# Altium project Interface-Board.PrjPcb
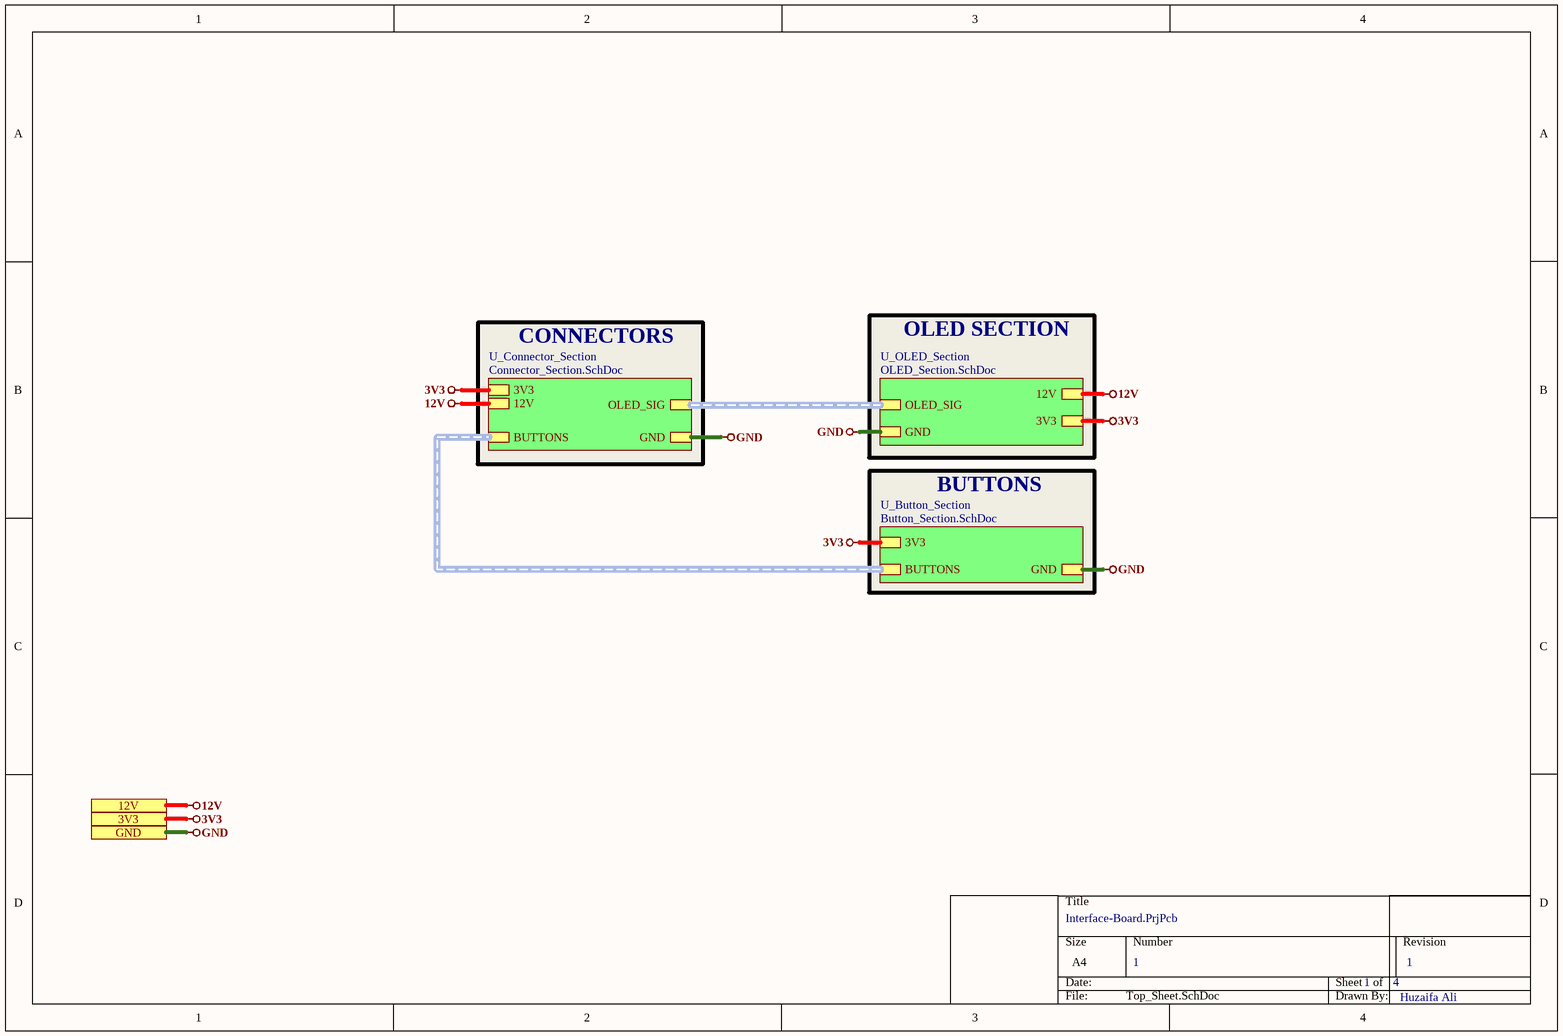
[diagram p0: Top_Sheet.SchDoc]
4 sheets, 19 parts. Net scope: hierarchical (ports join the sheet entries above them; power ports are global).
Board file: Interface_PCB.PcbDoc
Sheets:
  Top_Sheet.SchDoc
    U_Connector_Section = Connector_Section.SchDoc
    U_OLED_Section = OLED_Section.SchDoc
    U_Button_Section = Button_Section.SchDoc

## Sheet Top_Sheet.SchDoc: =Projectname
size A4; SheetNumber: 1; SheetTotal: 4

### Sub-sheets
U_Button_Section = Button_Section.SchDoc: BUTTONS (harness BUTTONS), 3V3, GND
U_Connector_Section = Connector_Section.SchDoc: OLED_SIG (harness OLED_SIG), BUTTONS (harness BUTTONS), 3V3, 12V, GND
U_OLED_Section = OLED_Section.SchDoc: 12V, 3V3, GND, OLED_SIG (harness OLED_SIG)

### Ports
3V3, 12V, GND

### Nets
3V3: port 3V3, sheet U_Connector_Section/3V3, sheet U_OLED_Section/3V3, sheet U_Button_Section/3V3
12V: port 12V, sheet U_Connector_Section/12V, sheet U_OLED_Section/12V
GND: port GND, sheet U_Connector_Section/GND, sheet U_OLED_Section/GND, sheet U_Button_Section/GND

### Buses and harness runs
harness sheet U_Button_Section/BUTTONS = sheet U_Connector_Section/BUTTONS
harness sheet U_Connector_Section/OLED_SIG = sheet U_OLED_Section/OLED_SIG

### Notes on the sheet
- CONNECTORS
- OLED SECTION
- BUTTONS
- 1
- Huzaifa Ali

## Sheet Connector_Section.SchDoc: =Projectname
size A4; SheetNumber: 3; SheetTotal: 4
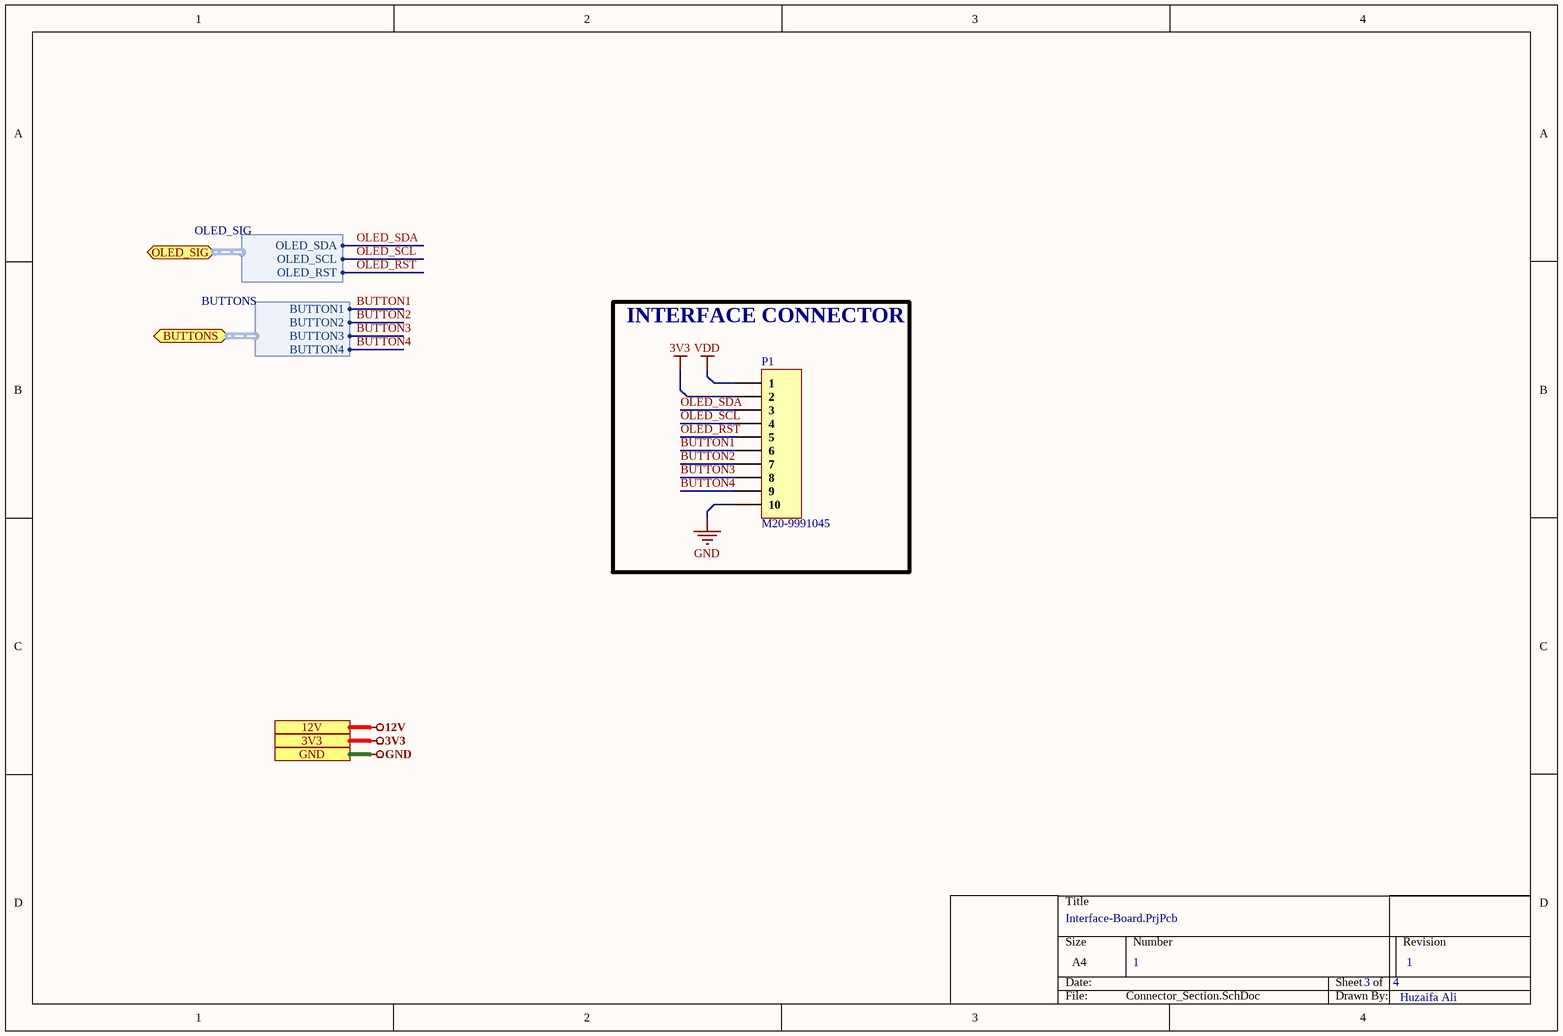
[diagram p1: Connector_Section.SchDoc]

### Parts
P1  M20-9991045  [HDR1X10]

### Blocks framed on the sheet
INTERFACE CONNECTOR: P1

### Ports
3V3, 12V, BUTTONS (bidir, harness BUTTONS), GND, OLED_SIG (bidir, harness OLED_SIG)

### Harnesses
OLED_SIG: OLED_SDA, OLED_SCL, OLED_RST
BUTTONS: BUTTON1, BUTTON2, BUTTON3, BUTTON4

### Nets
3V3: P1.2 ; port 3V3
GND: P1.10 ; port GND
VDD: P1.1
BUTTON1: P1.6 ; port BUTTONS.BUTTON1
BUTTON2: P1.7 ; port BUTTONS.BUTTON2
BUTTON3: P1.8 ; port BUTTONS.BUTTON3
BUTTON4: P1.9 ; port BUTTONS.BUTTON4
OLED_RST: P1.5 ; port OLED_SIG.OLED_RST
OLED_SCL: P1.4 ; port OLED_SIG.OLED_SCL
OLED_SDA: P1.3 ; port OLED_SIG.OLED_SDA

### Notes on the sheet
- 1
- Huzaifa Ali

### Library data of the parts
P1 = M20-9991045: CONN HEADER VERT 10POS 2.54MM; Manufacturer: Harwin; Number of Contacts: 10; Max Current Rating: 3A; Contact Resistance: 25mR; Gender: Male; Insulation Resistance: 10GR; Connector Type: Male Pin; Supplier 1: Digi-Key; Manufacturer Part Number: M20-9991045; Stock 1: 1623; Pricing 1: 1=0.44, 10=0.413, 100=0.2891, 500=0.2478, 1000=0.2065, 5000=0.177, 10000=0.1652 (USD); Mount: Through Hole; Case/Package: SIL; Weight: 0.020459oz; Color: Black; Contact Plating: Gold; Contact Material: Brass,Bronze; Housing Color: Black; Housing Material: Nylon; Min Operating Temperature: -40°C; Max Operating Temperature: 105°C; Number of Rows: 1; Termination: Solder; Packaging: Bulk; Current Rating: 3A; Package Quantity: 500; Number of Positions: 10; Orientation: Straight; Length: 25.4mm; Height: 0.125inch; Width: 0.5inch; Pitch: 2.54mm; Contact Mating Length: 0.24inch; Depth: 2.54mm; Radiation Hardening: No; REACH SVHC: No SVHC; ComponentLink1URL: http://www.mouser.com/ds/2/181/Harwin_Product_Catalog_page_206-1134556.pdf?src-supplier=Mouser; ComponentLink1Description: http://www.mouser.com/ds/2/181/Harwin_Product_Catalog_page_206-1134556.pdf?src-supplier=Mouser; ComponentLink2URL: http://www.farnell.com/cad/689114.pdf?src-supplier=Element14; ComponentLink2Description: http://www.farnell.com/cad/689114.pdf?src-supplier=Element14; Supplier Part Number 1: 952-1842-ND

## Sheet OLED_Section.SchDoc
size A4; SheetNumber: 2; SheetTotal: 4
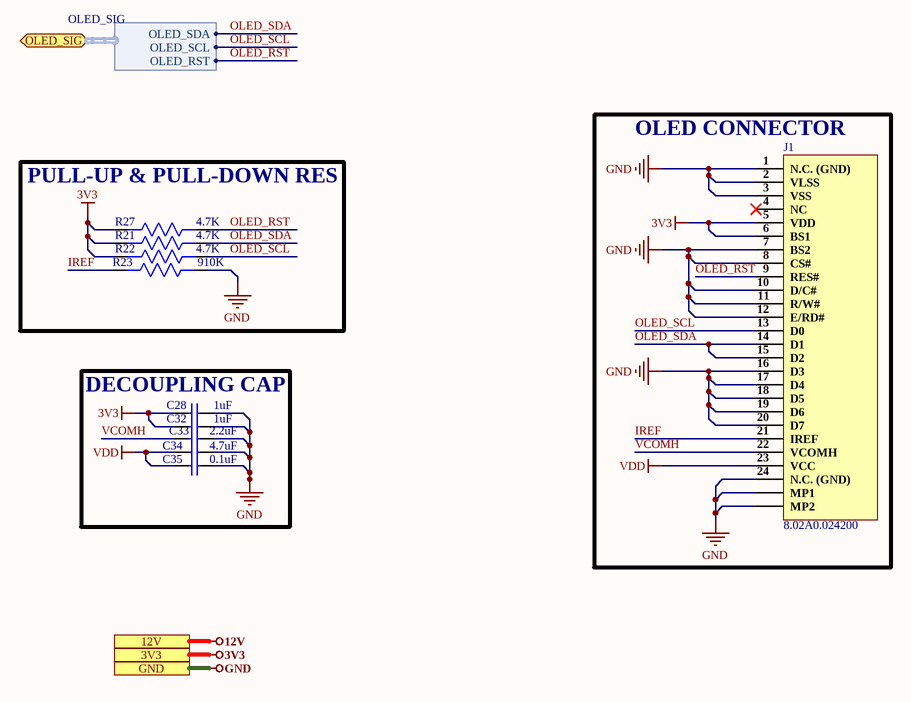
[diagram p2: OLED_Section.SchDoc]

### Parts
C28  1uF  [Cap 0402]
C32  1uF  [Cap 0402]
C33  2.2uF  [Cap 0402]
C34  4.7uF  [Cap 0603]
C35  0.1uF  [Cap 0402]
J1  8.02A0.024200  [8.02A0.024200]
R21  4.7K  [Res0402]
R22  4.7K  [Res0402]
R23  910K  [Res0603]
R27  4.7K  [Res0402]

### Blocks framed on the sheet
OLED CONNECTOR: J1
PULL-UP & PULL-DOWN RES: R21-R23 R27
DECOUPLING CAP: C28 C32-C35

### Ports
3V3, 12V, GND, OLED_SIG (bidir, harness OLED_SIG)

### Harnesses
OLED_SIG: OLED_SDA, OLED_SCL, OLED_RST

### Nets
3V3: C28.1 C32.1 J1.5(VDD) J1.6(BS1) R21.2 R22.2 R27.2 ; port 3V3
GND: C28.2 C32.2 C33.2 C34.2 C35.2 J1.1(N.C._(GND)) J1.2(VLSS) J1.3(VSS) J1.7(BS2) J1.8(CS#) J1.10(D/C#) J1.11(R/W#) J1.12(E/RD#) J1.16(D3) J1.17(D4) J1.18(D5) J1.19(D6) J1.20(D7) J1.24(N.C._(GND)) J1.MP1 J1.MP2 R23.1 ; port GND
VDD: C34.1 C35.1 J1.23(VCC)
IREF: J1.21(IREF) R23.2
OLED_RST: J1.9(RES#) R27.1 ; port OLED_SIG.OLED_RST
OLED_SCL: J1.13(D0) R22.1 ; port OLED_SIG.OLED_SCL
OLED_SDA: J1.14(D1) J1.15(D2) R21.1 ; port OLED_SIG.OLED_SDA
VCOMH: C33.1 J1.22(VCOMH)

Not connected (* = marked no-connect by the designer): J1 4(NC)*

### Notes on the sheet
- 1
- Huzaifa Ali

### Library data of the parts
C28 C32 = GRM155R61E105KA12D: CAP CER 1UF 25V X5R 0402; Manufacturer: Murata; Material: Ceramic; Tolerance: 10%; Supplier 1: Digi-Key; Manufacturer Part Number: GRM155R61E105KA12D; Stock 1: 1194305; Pricing 1: 1=0.11, 10=0.077, 100=0.0363, 500=0.02546, 1000=0.02108, 2500=0.01962, 5000=0.01795 (USD); Mount: Surface Mount; Case/Package: 0402; Weight: 0.000212oz; Case Code (Metric): 1005; Case Code (Imperial): 0402; Min Operating Temperature: -55°C; Max Operating Temperature: 85°C; Capacitance: 1uF; Voltage Rating: 25V; Packaging: Tape and Reel; Dielectric: X5R; Voltage: 25V; Termination: SMD/SMT; Voltage Rating (DC): 25V; Package Quantity: 10000; Length: 1mm; Height: 0.5mm; Width: 0.5mm; Thickness: 0.022inch; Depth: 0.5mm; REACH SVHC: No SVHC; Lead Free: Lead Free; ComponentLink1URL: http://www.farnell.com/datasheets/2048341.pdf?src-supplier=Element14; ComponentLink1Description: http://www.farnell.com/datasheets/2048341.pdf?src-supplier=Element14; Supplier Part Number 1: 490-10017-1-ND
C33 = EMK105ABJ225KV-F: CAP CER 2.2UF 16V X5R 0402; Manufacturer: Taiyo Yuden; Tolerance: 10%; Supplier 1: Digi-Key; Manufacturer Part Number: EMK105ABJ225KV-F; Stock 1: 755; Pricing 1: 1=0.2, 10=0.139, 100=0.0706, 500=0.04834, 1000=0.04276, 2500=0.0409, 5000=0.03718 (USD); Mount: Surface Mount; Case/Package: 0402; Case Code (Imperial): 0402; Case Code (Metric): 1005; Min Operating Temperature: -55°C; Max Operating Temperature: 85°C; Packaging: Tape and Reel; Capacitance: 2.2uF; Voltage Rating: 16V; Lead Free: Lead Free; ComponentLink1URL: http://ds.yuden.co.jp/TYCOMPAS/ut/detail.do?productNo=EMK105ABJ225KV-F&amp;fileName=EMK105ABJ225KV-F_SS&amp;mode=specSheetDownload&src-supplier=Digi-Key; ComponentLink1Description: http://ds.yuden.co.jp/TYCOMPAS/ut/detail.do?productNo=EMK105ABJ225KV-F&amp;fileName=EMK105ABJ225KV-F_SS&amp;mode=specSheetDownload&src-supplier=Digi-Key; ComponentLink2URL: https://ds.yuden.co.jp/TYCOMPAS/ut/detail?pn=EMK105ABJ225KV-F &amp;u=M&src-supplier=Digi-Key; ComponentLink2Description: https://ds.yuden.co.jp/TYCOMPAS/ut/detail?pn=EMK105ABJ225KV-F &amp;u=M&src-supplier=Digi-Key; Supplier Part Number 1: 587-6002-1-ND
C34 = CL10A475KA8NQNC: CAP CER 4.7UF 25V X5R 0603; Manufacturer: Samsung; Tolerance: 10%; Supplier 1: Digi-Key; Manufacturer Part Number: CL10A475KA8NQNC; Stock 1: 2252340; Pricing 1: 1=0.37, 10=0.255, 100=0.1528, 500=0.11456, 1000=0.09675 (USD); Mount: Surface Mount; Case/Package: 0603; Case Code (Metric): 1608; Case Code (Imperial): 0603; Contact Plating: Tin; Min Operating Temperature: -55°C; Max Operating Temperature: 85°C; Package Quantity: 1; Packaging: Tape and Reel; Capacitance: 4.7uF; Voltage Rating: 25V; Dielectric: X5R; Termination: Wraparound; Length: 1.6mm; Width: 0.031inch; Thickness: 0.035inch; Depth: 0.8mm; Lead Free: Lead Free; ComponentLink1URL: http://www.samsungsem.com/kr/support/product-search/mlcc/CL10A475KA8NQNC.jsp?src-supplier=Digi-Key; ComponentLink1Description: http://www.samsungsem.com/kr/support/product-search/mlcc/CL10A475KA8NQNC.jsp?src-supplier=Digi-Key; Supplier Part Number 1: 1276-1900-1-ND
C35 = CC0402KRX7R7BB104: CAP CER 0.1UF 16V X7R 0402; Manufacturer: Yageo; Tolerance: 10%; Capacitance: 100nF; Supplier 1: Digi-Key; Manufacturer Part Number: CC0402KRX7R7BB104; Stock 1: 16982736; Pricing 1: 1=0.1, 10=0.034, 100=0.015, 500=0.0107, 1000=0.00841, 2500=0.00764, 5000=0.00703 (USD); Mount: Surface Mount; Case/Package: 0402; Number of Pins: 2; Case Code (Metric): 1005; Case Code (Imperial): 0402; Min Operating Temperature: -55°C; Max Operating Temperature: 125°C; Dielectric: X7R; Voltage Rating: 16V; Voltage Rating (DC): 16V; Packaging: Tape and Reel; Package Quantity: 1; Termination: SMD/SMT; Composition: Ceramic; Voltage: 16V; Length: 1mm; Height: 0.5mm; Width: 0.02inch; Thickness: 0.022inch; Depth: 0.5mm; Radiation Hardening: No; REACH SVHC: No SVHC; Lead Free: Lead Free; Halogen Free: Halogen Free; ComponentLink1URL: http://www.yageo.com/documents/recent/UPY-GPHC_X7R_6.3V-to-50V_8.pdf?src-supplier=Avnet+Europe; ComponentLink1Description: http://www.yageo.com/documents/recent/UPY-GPHC_X7R_6.3V-to-50V_8.pdf?src-supplier=Avnet+Europe; ComponentLink2URL: http://www.yageo.com/documents/recent/UPY-GPHC_X7R_6.3V-to-50V_18.pdf?src-supplier=Digi-Key; ComponentLink2Description: http://www.yageo.com/documents/recent/UPY-GPHC_X7R_6.3V-to-50V_18.pdf?src-supplier=Digi-Key; ComponentLink3URL: http://www.yageo.com/documents/recent/UPY-GPHC_X7R_6.3V-to-50V_8.pdf?src-supplier=Avnet; ComponentLink3Description: http://www.yageo.com/documents/recent/UPY-GPHC_X7R_6.3V-to-50V_8.pdf?src-supplier=Avnet; ComponentLink4URL: http://www.yageo.com/documents/recent/UPY-GPHC_X7R_6.3V-to-50V_18.pdf?src-supplier=Mouser; ComponentLink4Description: http://www.yageo.com/documents/recent/UPY-GPHC_X7R_6.3V-to-50V_18.pdf?src-supplier=Mouser; ComponentLink5URL: http://www.farnell.com/datasheets/2167236.pdf?src-supplier=Element14; ComponentLink5Description: http://www.farnell.com/datasheets/2167236.pdf?src-supplier=Element14; ComponentLink6URL: http://www.farnell.com/datasheets/1489800.pdf?src-supplier=Element14; ComponentLink6Description: http://www.farnell.com/datasheets/1489800.pdf?src-supplier=Element14; Supplier Part Number 1: 311-1338-1-ND
J1 = 8.02A0.024200: FPC Connector 0.5mm pitch 24pin 30pin TOP&bottom conduction Zif Smt Lcd/epaper Fpc Ffc Connector; ComponentLink1Description: Alibaba; ComponentLink1URL: https://www.alibaba.com/product-detail/FPC-Connector-0-5mm-pitch-24pin_1600228276659.html; Manufacturer: *; Manufacturer Part No: 8.02A0.024200; Package: *
R21 R22 R27 = CR0402JF0472G: 4.7K ±5% 1/16W ±200ppm/°C 0402 Chip Resistor - Surface Mount RoHS; Manufacturer: LIZ Elec; Manufacturer Part No: CR0402JF0472G; Package: 0402; Value: 4.7K
R23 = 0603WAF9103T5E: ±1% 1/10W Thick Film Resistors 75V ±100ppm/℃ -55℃~+155℃ 910kΩ 0603 Chip Resistor - Surface Mount ROHS; Manufacturer: UNI-ROYAL; Manufacturer Part No: 0603WAF9103T5E; Package: 0603; Value: 910K; ComponentLink1Description: LCSC; ComponentLink1URL: https://lcsc.com/product-detail/Chip-Resistor-Surface-Mount_UNI-ROYAL-Uniroyal-Elec-0603WAF9103T5E_C23263.html

## Sheet Button_Section.SchDoc: =Projectname
size A4; SheetNumber: 4; SheetTotal: 4
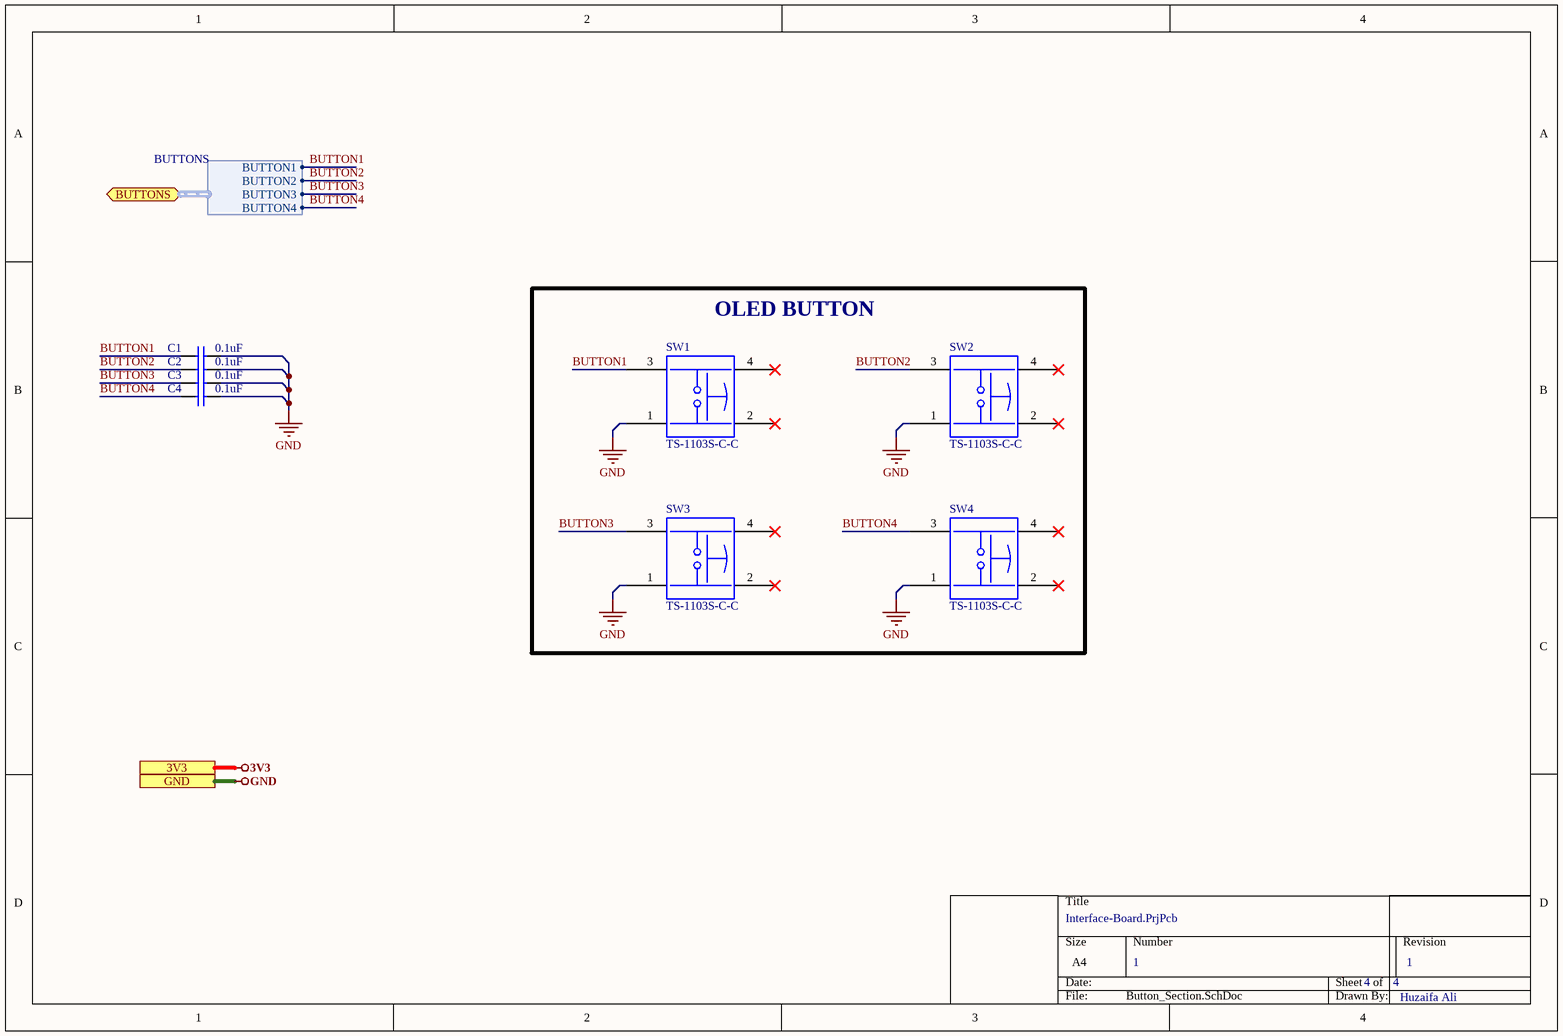
[diagram p3: Button_Section.SchDoc]

### Parts
C1  0.1uF  [Cap 0402]
C2  0.1uF  [Cap 0402]
C3  0.1uF  [Cap 0402]
C4  0.1uF  [Cap 0402]
SW1  TS-1103S-C-C  [TS-1103S-C-C]
SW2  TS-1103S-C-C  [TS-1103S-C-C]
SW3  TS-1103S-C-C  [TS-1103S-C-C]
SW4  TS-1103S-C-C  [TS-1103S-C-C]

### Blocks framed on the sheet
OLED BUTTON: SW1-SW4

### Ports
3V3, BUTTONS (bidir, harness BUTTONS), GND

### Harnesses
BUTTONS: BUTTON1, BUTTON2, BUTTON3, BUTTON4

### Nets
GND: C1.2 C2.2 C3.2 C4.2 SW1.1 SW2.1 SW3.1 SW4.1 ; port GND
BUTTON1: C1.1 SW1.3 ; port BUTTONS.BUTTON1
BUTTON2: C2.1 SW2.3 ; port BUTTONS.BUTTON2
BUTTON3: C3.1 SW3.3 ; port BUTTONS.BUTTON3
BUTTON4: C4.1 SW4.3 ; port BUTTONS.BUTTON4

Not connected (* = marked no-connect by the designer): SW1 2* 4*; SW2 2* 4*; SW3 2* 4*; SW4 2* 4*

### Notes on the sheet
- 1
- Huzaifa Ali

### Library data of the parts
C1-C4 = CC0402KRX7R7BB104: as C35 on sheet OLED_Section; Supplier 1: Digi-Key; Manufacturer Part Number: CC0402KRX7R7BB104; Stock 1: 16982736; Pricing 1: 1=0.1, 10=0.034, 100=0.015, 500=0.0107, 1000=0.00841, 2500=0.00764, 5000=0.00703 (USD); Mount: Surface Mount; Case/Package: 0402; Number of Pins: 2; Case Code (Metric): 1005; Case Code (Imperial): 0402; Min Operating Temperature: -55°C; Max Operating Temperature: 125°C; Dielectric: X7R; Voltage Rating: 16V; Voltage Rating (DC): 16V; Packaging: Tape and Reel; Package Quantity: 1; Termination: SMD/SMT; Composition: Ceramic; Voltage: 16V; Length: 1mm; Height: 0.5mm; Width: 0.02inch; Thickness: 0.022inch; Depth: 0.5mm; Radiation Hardening: No; REACH SVHC: No SVHC; Lead Free: Lead Free; Halogen Free: Halogen Free; ComponentLink1URL: http://www.yageo.com/documents/recent/UPY-GPHC_X7R_6.3V-to-50V_8.pdf?src-supplier=Avnet+Europe; ComponentLink1Description: http://www.yageo.com/documents/recent/UPY-GPHC_X7R_6.3V-to-50V_8.pdf?src-supplier=Avnet+Europe; ComponentLink2URL: http://www.yageo.com/documents/recent/UPY-GPHC_X7R_6.3V-to-50V_18.pdf?src-supplier=Digi-Key; ComponentLink2Description: http://www.yageo.com/documents/recent/UPY-GPHC_X7R_6.3V-to-50V_18.pdf?src-supplier=Digi-Key; ComponentLink3URL: http://www.yageo.com/documents/recent/UPY-GPHC_X7R_6.3V-to-50V_8.pdf?src-supplier=Avnet; ComponentLink3Description: http://www.yageo.com/documents/recent/UPY-GPHC_X7R_6.3V-to-50V_8.pdf?src-supplier=Avnet; ComponentLink4URL: http://www.yageo.com/documents/recent/UPY-GPHC_X7R_6.3V-to-50V_18.pdf?src-supplier=Mouser; ComponentLink4Description: http://www.yageo.com/documents/recent/UPY-GPHC_X7R_6.3V-to-50V_18.pdf?src-supplier=Mouser; ComponentLink5URL: http://www.farnell.com/datasheets/2167236.pdf?src-supplier=Element14; ComponentLink5Description: http://www.farnell.com/datasheets/2167236.pdf?src-supplier=Element14; ComponentLink6URL: http://www.farnell.com/datasheets/1489800.pdf?src-supplier=Element14; ComponentLink6Description: http://www.farnell.com/datasheets/1489800.pdf?src-supplier=Element14; Supplier Part Number 1: 311-1338-1-ND
SW1-SW4 = TS-1103S-C-C: No NO 50mA 12mm 100mΩ 200000 260gf 12V -30℃~+85℃ 12mm 5mm Black Round Button Brick nogging SPST SMD Tactile Switches ROHS; Manufacturer: XKB; ComponentLink1Description: LCSC; ComponentLink1URL: https://lcsc.com/product-detail/Tactile-Switches_XKB-Connectivity-TS-1103S-C-C_C318916.html; Manufacturer Part No: TS-1103S-C-C; Package: Custom

## Nets that join several sheets
3V3: Connector_Section (P1.2), OLED_Section (7 pins)
GND: Connector_Section (P1.10), OLED_Section (22 pins), Button_Section (8 pins)
VDD: Connector_Section (P1.1), OLED_Section (C34.1 C35.1 J1.23)
BUTTON1: Connector_Section (P1.6), Button_Section (C1.1 SW1.3)
BUTTON2: Connector_Section (P1.7), Button_Section (C2.1 SW2.3)
BUTTON3: Connector_Section (P1.8), Button_Section (C3.1 SW3.3)
BUTTON4: Connector_Section (P1.9), Button_Section (C4.1 SW4.3)
OLED_RST: Connector_Section (P1.5), OLED_Section (J1.9 R27.1)
OLED_SCL: Connector_Section (P1.4), OLED_Section (J1.13 R22.1)
OLED_SDA: Connector_Section (P1.3), OLED_Section (J1.14 J1.15 R21.1)